# Altium schematic sheet Load12.SchDoc
size A4; SheetNumber: 15; SheetTotal: 15
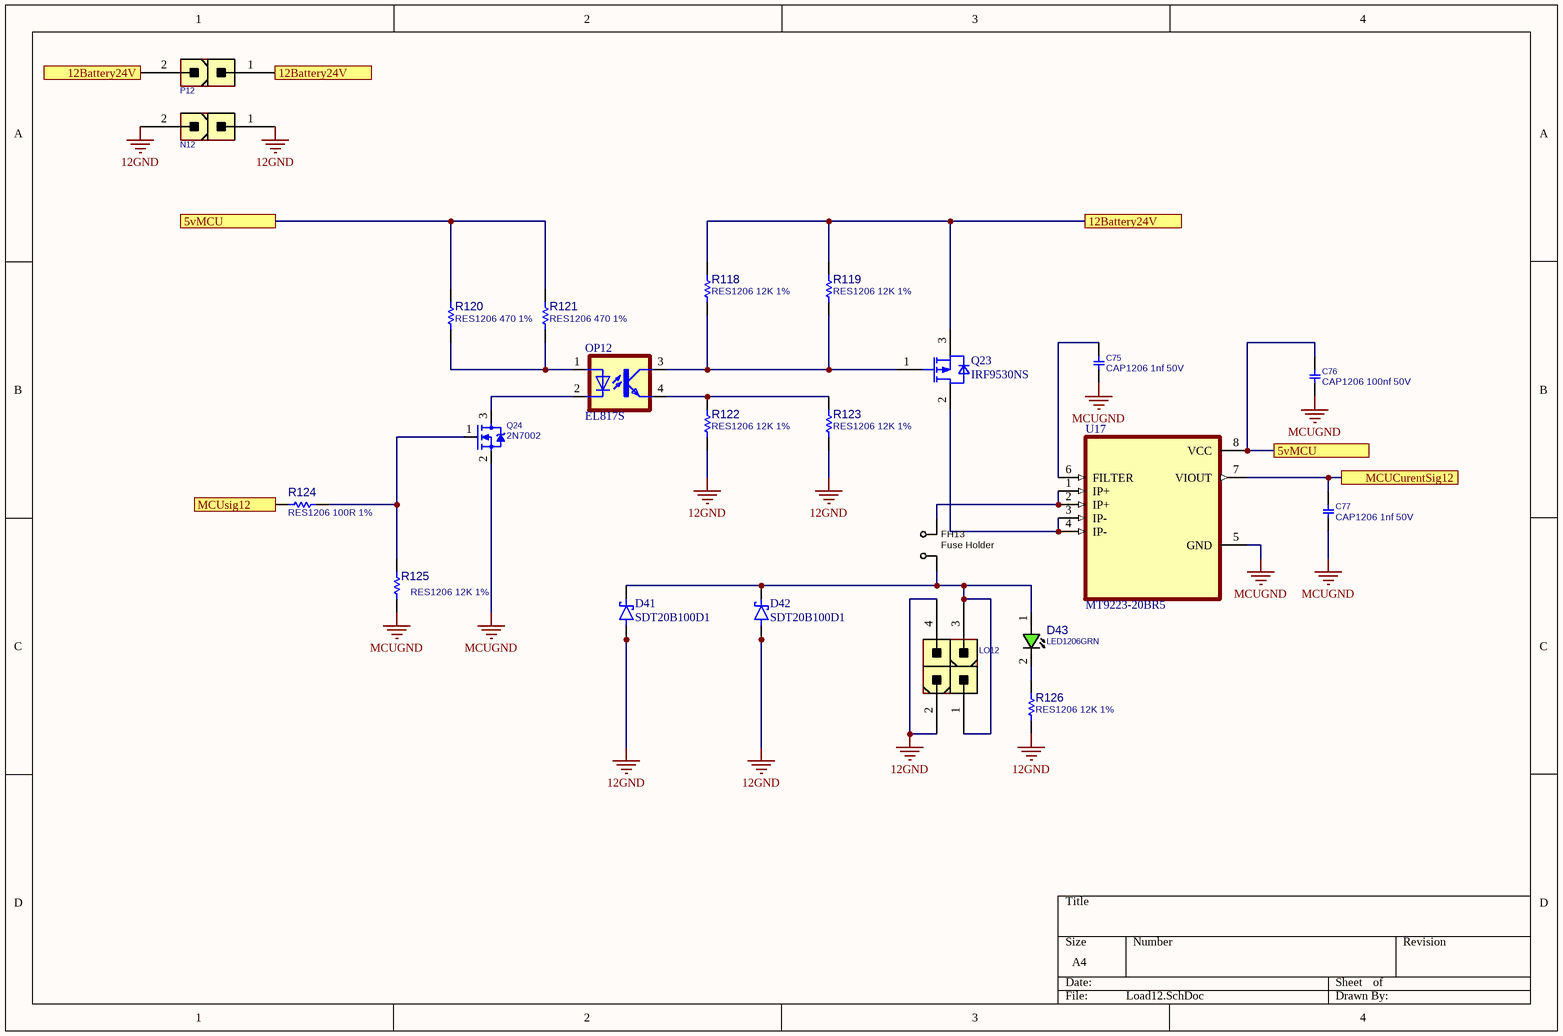
[diagram p0: Load12.SchDoc]

## Parts
C75  CAP1206 1nf 50V  [C1206]
C76  CAP1206 100nf 50V  [C1206]
C77  CAP1206 1nf 50V  [C1206]
D41  SDT20B100D1  [DPAK229P990X238-3N]
D42  SDT20B100D1  [DPAK229P990X238-3N]
D43  LED1206GRN  [LED1206GRN]
FH13  Fuse Holder  [FH_24101812]
LO12  CONN_ATXPWR_4  [ATXPWR_4]  (value not drawn)
N12  CONN_ATXPWR_2  [ATXPWR_2]  (value not drawn)
OP12  EL817S  [SOIC254P1030X460-4N]
P12  CONN_ATXPWR_2  [ATXPWR_2]  (value not drawn)
Q23  IRF9530NS  [TO254P1528X508-4_3N-V1]
Q24  2N7002  [SOT23_3]
R118  RES1206 12K 1%  [R1206]
R119  RES1206 12K 1%  [R1206]
R120  RES1206 470 1%  [R1206]
R121  RES1206 470 1%  [R1206]
R122  RES1206 12K 1%  [R1206]
R123  RES1206 12K 1%  [R1206]
R124  RES1206 100R 1%  [R1206]
R125  RES1206 12K 1%  [R1206]
R126  RES1206 12K 1%  [R1206]
U17  MT9223-20BR5  [SOIC127P600X175-8N]

## Ports
5vMCU, 12Battery24V, MCUCurentSig12, MCUsig12

## Nets
12GND: D41.1(A) D41.3(A__1) D42.1(A) D42.3(A__1) LO12.2 LO12.4 N12.1 N12.2 R122.2 R123.2 R126.2
MCUGND: C75.2 C76.2 C77.2 Q24.2(SOURCE) R125.2 U17.5(GND)
5vMCU: C76.1 R120.2 R121.2 U17.8(VCC) ; port 5vMCU
12Battery24V: P12.1 P12.2 Q23.3(SOURCE) R118.1 R119.1 ; port 12Battery24V
MCUCurentSig12: C77.1 U17.7(VIOUT) ; port MCUCurentSig12
MCUsig12: R124.1 ; port MCUsig12
NetC75_1: C75.1 U17.6(FILTER)
NetD41_4: D41.4(K) D42.4(K) D43.1(ANODE) FH13.1 LO12.1 LO12.3
NetD43_2: D43.2(CATHODE) R126.1
NetFH13_2: FH13.2 U17.1(IP+) U17.2(IP+)
NetOP12_1: OP12.1(A) R120.1 R121.1
NetOP12_2: OP12.2(C) Q24.3(DRAIN)
NetOP12_3: OP12.3(COL) Q23.1(GATE) R118.2 R119.2
NetOP12_4: OP12.4(EMIT) R122.1 R123.1
NetQ23_2: Q23.2(DRAIN) U17.3(IP-) U17.4(IP-)
NetQ24_1: Q24.1(GATE) R124.2 R125.1

## Library data of the parts
C75-C77 = CAP_SMD_MLCC_1206: CAP, MLCC; PARAM: -, -%; MANF_P#: MANF_PART#; PARAM2: -V; PRICE: 100= 1$; MANF: -; ASSEMBLY: ASSEMBLY
D41 D42 = MBRD835L: Diode Schottky 35 V 8A Surface Mount DPAK; MF: ON Semiconductor; SnapEDA_Link: https://www.snapeda.com/parts/MBRD835L/Onsemi/view-part/?ref=snap; Package: TO-252-3 MICROSS/On Semiconductor; Value: *; MP: MBRD835L; Check_prices: https://www.snapeda.com/parts/MBRD835L/Onsemi/view-part/?ref=eda
D43 = LED_SMD_1206_GRN: LED, SMD, 1206, GREEN; PARAM: 20mA; DESC: DESCRIPTION; PARAM2: 2.2V; MANF: -; ASSEMBLY: ASSEMBLY; PRICE: 36t@Javan; MANF_P#: -; VALUE: LED1206GRN; MountType: SMT; PartType: LED
FH13 = FUSE_SMD_HOLDER_24101812: Fuse SMD2410 Holder; PARAM: max. 10A; MANF: Littelfuse; MANF_P#: 01550900M; PARAM2: 125v; PRICE: 0.2$; PACKAGE: SMD,5.0x9.7mm; VALUE: Fuse Holder
LO12 = CONN_ATXPWR_4: CONN, ATX POWER, 4 P; MANF: TE, Molex; MANF_P#: 4-1775099-0, 39281043; VALUE: CONN_ATXPWR_4; MountType: THD; PACKAGE: ATXPWR-4pin; Part Type: Conn.
N12 P12 = CONN_ATXPWR_2: CONN, ATX POWER, 2 P; MANF: Molex; MANF_P#: 39281023; VALUE: CONN_ATXPWR_2; MountType: THD; PACKAGE: ATXPWR-2pin; Part Type: Conn.
OP12 = EL817S: Optoisolator Transistor Output 5000Vrms 1 Channel 4-SMD; MF: Everlight Electronics; SnapEDA_Link: https://www.snapeda.com/parts/EL817S/Everlight+Electronics+Co+Ltd/view-part/?ref=snap; Package: SMD-4 Everlight Electronics Co Ltd; Value: *; MP: EL817S; Check_prices: https://www.snapeda.com/parts/EL817S/Everlight+Electronics+Co+Ltd/view-part/?ref=eda
Q23 = IRF9530NS: OptiMOS - P2 Power-Transistor, P-channel-Enhancement mode, VDS -30V; Manufacturer: Infineon Technologies; Manufacturer Order NumberManufacturer Order Number: IRF9530NS; PackageReference: PG-TO263-3-901
Q24 = MOSN_2N7002_SOT23: MOSFET, N-CH, 60V, 0.3A; MANF: NXP; ASSEMBLY: ASSEMBLY; MANF_P#: 2N7002; PARAM2: 60v; PARAM: 0.3A; PRICE: 0.3t@Javan; VALUE: 2N7002
R118-R126 = RES_SMD_1206: RESISTOR, SMD; PARAM: 1%, 0.25W; DESC: DESCRIPTION; DIST#: MOUSER; MANF_P#: -; MANF: -; ASSEMBLY: ASSEMBLY; PRICE: -; PARAM2: -
U17 = ACS712ELCTR-05B-T: MF: {'manufacturer': u'Allegro MicroSystems'}; Package: None; Price: None; Value: *; MP: ACS712ELCTR-05B-T; Availability: Unavailable